# Altium schematic sheet NanoD1_Power.SchDoc
size 420 x 297 mm; ENG_APP_DATE: --/--/--; DSN_APP_DATE: --/--/--; CHK_APP_DATE: --/--/--; SheetNumber: 1; SheetTotal: 8
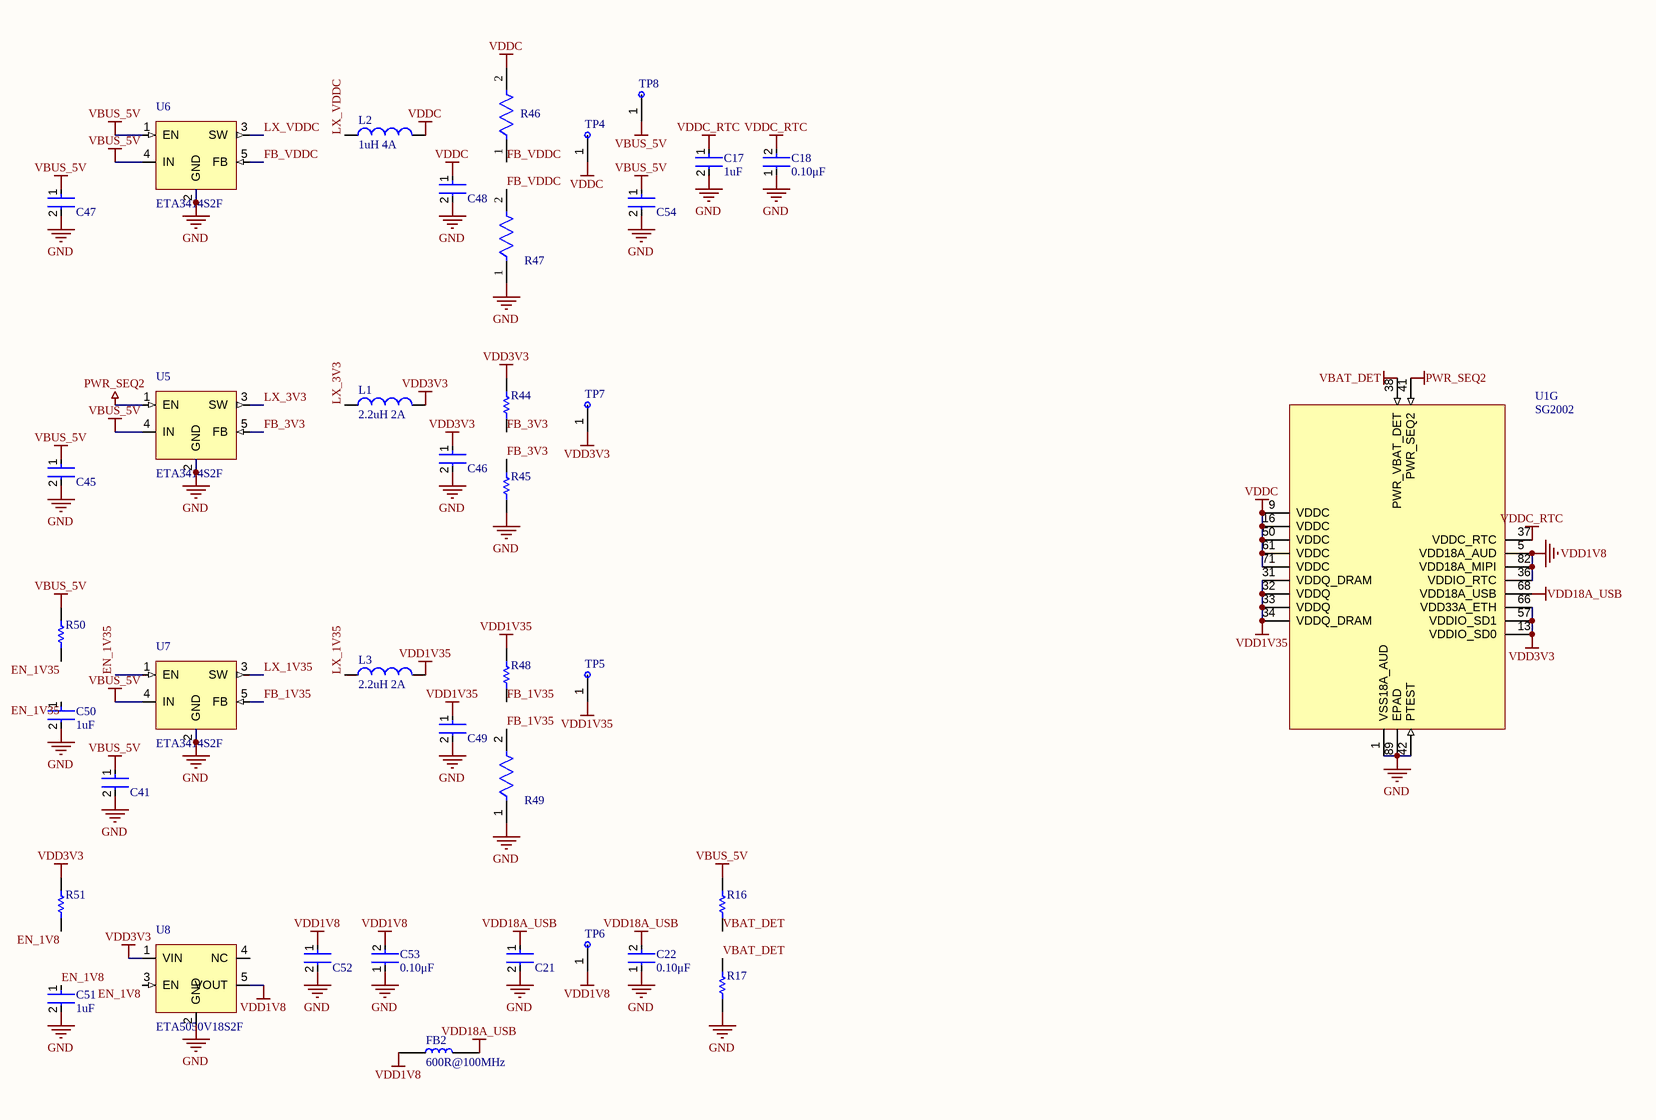
[diagram p0: NanoD1_Power.SchDoc]

## Parts
C17  1uF  [FP-GRM15-0_1-IPC_B]
C18  value 0.10μF  [FP-GRM15-MFG]  (hidden comment: 100nF)
C21  10uF  [FP-GRM188-0_15-IPC_B]  (value not drawn)
C22  value 0.10μF  [FP-GRM15-MFG]  (hidden comment: 100nF)
C41  22uF  [FP-GRM21B-0_15-MFG]  (value not drawn)
C45  22uF  [FP-GRM21B-0_15-MFG]  (value not drawn)
C46  22uF  [FP-GRM188-0_2-IPC_C]  (value not drawn)
C47  22uF  [FP-GRM21B-0_15-MFG]  (value not drawn)
C48  22uF  [FP-GRM188-0_2-IPC_C]  (value not drawn)
C49  22uF  [FP-GRM188-0_2-IPC_C]  (value not drawn)
C50  1uF  [FP-GRM15-0_1-IPC_B]
C51  1uF  [FP-GRM15-0_1-IPC_B]
C52  4.7uF  [FP-GRM155-0_15-MFG]  (value not drawn)
C53  value 0.10μF  [FP-GRM15-MFG]  (hidden comment: 100nF)
C54  22uF  [FP-GRM21B-0_15-MFG]  (value not drawn)
FB2  600R@100MHz  [INDC1608X95N]
L1  2.2uH 2A  [FP-DFE252010C-MFG]
L2  value 1uH 4A  [FP-DFE252010C-MFG]  (hidden comment: 1.0uH 4A)
L3  2.2uH 2A  [FP-DFE252010C-MFG]
R16  30K 1%  [RESC1005X40X25ML05T10]  (value not drawn)
R17  10K 1%  [RESC1005X40X25ML05T10]  (value not drawn)
R44  100K 1%  [RESC1005X40X25ML05T10]  (value not drawn)
R45  22K6 1%  [RESC1005X40X25ML05T10]  (value not drawn)
R46  11K8 1%  [FP-RC0402-0_4-MFG]  (value not drawn)
R47  20K 1%  [FP-RC0402-0_4-MFG]  (value not drawn)
R48  15K 1%  [RESC1005X40X25ML05T10]  (value not drawn)
R49  12K 1%  [FP-RC0402-0_4-MFG]  (value not drawn)
R50  33K  [RESC1005X40X25ML05T10]  (value not drawn)
R51  33K  [RESC1005X40X25ML05T10]  (value not drawn)
TP4  TP  [TP-1.5mm]  (value not drawn)
TP5  TP  [TP-1.5mm]  (value not drawn)
TP6  TP  [TP-1.5mm]  (value not drawn)
TP7  TP  [TP-1.5mm]  (value not drawn)
TP8  TP  [TP-1.5mm]  (value not drawn)
U1  SG2002  [QFN88-9x9-0.35]  (part G of 7)
U5  ETA3414S2F  [SOT23-5]
U6  ETA3414S2F  [SOT23-5]
U7  ETA3414S2F  [SOT23-5]
U8  ETA5050V18S2F  [SOT23-5]

## Nets
GND: C17.2 C18.1 C21.2 C22.1 C41.2 C45.2 C46.2 C47.2 C48.2 C49.2 C50.2 C51.2 C52.2 C53.1 C54.2 R17.1 R45.1 R47.1 R49.1 U1.1(VSS18A_AUD) U1.42(PTEST) U1.89(EPAD) U5.2(GND) U6.2(GND) U7.2(GND) U8.2(GND)
PWR_SEQ2: U1.41(PWR_SEQ2) U5.1(EN)
VBAT_DET: R16.1 R17.2 U1.38(PWR_VBAT_DET)
VBUS_5V: C41.1 C45.1 C47.1 C54.1 R16.2 R50.2 TP8.1(TP) U5.4(IN) U6.1(EN) U6.4(IN) U7.4(IN)
VDD1V8: C52.1 C53.2 FB2.1 TP6.1(TP) U1.5(VDD18A_AUD) U1.36(VDDIO_RTC) U1.82(VDD18A_MIPI) U8.5(VOUT)
VDD1V35: C49.1 L3.2 R48.2 TP5.1(TP) U1.31(VDDQ_DRAM) U1.32(VDDQ) U1.33(VDDQ) U1.34(VDDQ_DRAM)
VDD3V3: C46.1 L1.2 R44.2 R51.2 TP7.1(TP) U1.13(VDDIO_SD0) U1.57(VDDIO_SD1) U1.66(VDD33A_ETH) U8.1(VIN)
VDD18A_USB: C21.1 C22.2 FB2.2 U1.68(VDD18A_USB)
VDDC: C48.1 L2.2 R46.2 TP4.1(TP) U1.9(VDDC) U1.16(VDDC) U1.50(VDDC) U1.61(VDDC) U1.71(VDDC)
VDDC_RTC: C17.1 C18.2 U1.37(VDDC_RTC)
EN_1V8: C51.1 R51.1 U8.3(EN)
EN_1V35: C50.1 R50.1 U7.1(EN)
FB_1V35: R48.1 R49.2 U7.5(FB)
FB_3V3: R44.1 R45.2 U5.5(FB)
FB_VDDC: R46.1 R47.2 U6.5(FB)
LX_1V35: L3.1 U7.3(SW)
LX_3V3: L1.1 U5.3(SW)
LX_VDDC: L2.1 U6.3(SW)

Not connected (* = marked no-connect by the designer): U8 4(NC)

## Notes on the sheet
- THIS DOCUMENT AND THE DATA DISCLOSED HEREIN OR
- HEREWITH IS THE PROPERTY OF ALTIUM LIMITED AND MAY
- DWG NO:
- REVISION
- REV:
- DESCRIPTION
- DATE
- APPROVED
- BE FREELY DISTRIBUTED IN WHOLE. NO RIGHTS ARE
- RESERVED OR EXPRESS OR IMPLIED WARANTEE GIVEN.
- ENG:
- APPROVALS
- PROJECT
- DSN:
- CHK:
- REFERENCE DOCUMENTS
- PROJECT REVISION:
- TITLE
- DOCUMENT REVISION:
- DESIGN ITEM:
- BOM:
- FAB DWG:
- PCB DWG:
- ASSY DWG:
- SCALE:
- A3
- SIZE
- CAGE CODE
- FILE NAME
- DWG NO.
- SHEET
- OF
- REV

## Library data of the parts
C17 C50 C51 = CMP-2008-04556-2: CAP CER 1UF 10V X5R 0402; Manufacturer Part Number: GRM155R61A105KE15D; Manufacturer: Murata; Material: Ceramic; Tolerance: 10%; Temperature Coefficient: 15%; Value: 1uF; Octopart: https://octopart.com/grm155r61a105ke15d-murata-197442; Lead Free: Yes; ComponentLink2Description: Datasheet; Temperature: -55°C to +85°C; Temperature Range High: +85°C; Height: 0.55mm; Capacitance: 1uF; Ipc Land Pattern Name: CAPC10050X50; ComponentLink2URL: https://search.murata.co.jp/Ceramy/image/img/A01X/G101/ENG/GRM155R61A105KE15-01A.pdf; Temperature Range Low: -55°C; Device Class L2: Capacitors; Voltage Rating: 10V; RoHS: TRUE; Device Class L1: Passive Components; Device Class L3: Ceramic Capacitors; Temperature Characteristic: X5R; Mouser Description: 0402 1 uF 10 V ±10% Tolerance X5R Surface Mount Multilayer Ceramic Capacitor; Automotive: No; Package: GRM15-0.1; Digikey Description: CAP CER 1UF 10V X5R 0402; Category: Cap
C18 C22 C53 = CMP-2100-03641-2: CAP CER 0.1UF 16V X7R 0402; Manufacturer Part Number: GRM155R71C104KA88D; Manufacturer: Murata; Standoff Height: 0mm; Tolerance: 10%; Voltage Rating: 16Vdc; Material: Ceramic; RoHS: TRUE; Temperature Characteristic: X7R; Octopart: https://octopart.com/grm155r71c104ka88d-murata-196880; Digikey Description: CAP CER 0.1UF 16V X7R 0402; Device Class L3: Ceramic Capacitors; Height: 0.55mm; ComponentLink2Description: Datasheet; Temperature Range Low: -55°C; Ipc Land Pattern Name: CAPC10050X219; ComponentLink2URL: https://search.murata.co.jp/Ceramy/image/img/A01X/G101/ENG/GRM155R71H471KA01-01A.pdf; Device Class L1: Passive Components; Lead Free: yes; Category: Cap; Package: GRM15; Temperature: -55°C to +125°C; Device Class L2: Capacitors; Capacitance: 0.10μF; Temperature Range High: +125°C; Mouser Description: 0402 0.1 uF 16V ±10 % Tolerance X7R SMT Multilayer Ceramic Capacitor
C21 = CMP-06035-003612-1: Chip Multilayer Ceramic Capacitors for General Purpose, 0603, 10uF, X5R, 15%, 20%, 10V; Tolerance: 20%; Dielectric: X5R; Package Quantity: 4000; Width: 0.8mm; Case/Package: 0603; Thickness: 0.035inch; Capacitance: 10uF; Voltage Rating: 10V; Voltage Rating (DC): 10V; Termination: SMD/SMT; Length: 1.6mm; Lead Free: Lead Free; Mount: Surface Mount; Height: 0.8mm; Depth: 0.8mm; Packaging: Tape and Reel; Weight: 0.000222oz; Min Operating Temperature: -55°C; Case Code (Metric): 1608; Max Operating Temperature: 85°C; Case Code (Imperial): 0603; Material: Ceramic
C41 C45 C47 C54 = CMP-2000-06340-2: Chip Multilayer Ceramic Capacitors for General Purpose, 0805, 22uF, X5R, 15%, 20%, 10V; Thickness: 0.055inch; Length: 2mm; Tolerance: 20%; Max Operating Temperature: 85°C; REACH SVHC: No SVHC; Capacitance: 22uF; Voltage Rating: 10V; Weight: 0.000335oz; Case Code (Metric): 2012; Case Code (Imperial): 0805; Height: 1.25mm; Min Operating Temperature: -55°C; Voltage Rating (DC): 10V; Lead Free: Lead Free; Package Quantity: 3000; Case/Package: 0805; Dielectric: X5R; Mount: Surface Mount; Termination: SMD/SMT; Width: 0.049inch; Depth: 1.25mm; Packaging: Tape and Reel; Radiation Hardening: No
C46 C48 C49 = CMP-2000-06337-3: Chip Multilayer Ceramic Capacitors for General Purpose, 0603, 22uF, X5R, 15%, 20%, 10V; Thickness: 0.039inch; Length: 1.6mm; Tolerance: 20%; Max Operating Temperature: 85°C; REACH SVHC: No SVHC; Capacitance: 22uF; Voltage Rating: 10V; Weight: 0.000222oz; Case Code (Metric): 1608; Case Code (Imperial): 0603; Height: 0.8mm; Min Operating Temperature: -55°C; Voltage Rating (DC): 10V; Lead Free: Lead Free; Package Quantity: 4000; Case/Package: 0603; Dielectric: X5R; Mount: Surface Mount; Termination: SMD/SMT; Width: 0.8mm; Depth: 0.8mm; Packaging: Tape and Reel; Material: Ceramic
C52 = CMP-06035-003573-1: Chip Multilayer Ceramic Capacitors for General Purpose, 0402, 4.7uF, X5R, 15%, 20%, 10V; Case/Package: 0402; Voltage Rating: 10V; Min Operating Temperature: -55°C; Mount: Surface Mount; Packaging: Tape and Reel; Max Operating Temperature: 85°C; Capacitance: 4.7uF; Case Code (Metric): 1005; Case Code (Imperial): 0402; Tolerance: 20%
FB2 = MPZ1608S601ATA00: 600 Ohms @ 100 MHz 1 Power Line Ferrite Bead 0603 (1608 Metric) 1A 150mOhm; MF: TDK; SnapEDA_Link: https://www.snapeda.com/parts/MPZ1608S601ATA00/TDK/view-part/?ref=snap; Package: 0603 TDK; Value: 600R@100MHz; MP: MPZ1608S601ATA00; Check_prices: https://www.snapeda.com/parts/MPZ1608S601ATA00/TDK/view-part/?ref=eda
L1-L3 = Inductor: Code_IEC: 1005; Published: 8-Jun-2000; LatestRevisionDate: 29-May-2009; LatestRevisionNote: IPC-7351 Footprint Added.; PackageReference: 0402-A; Publisher: Altium Limited; PackageDescription: Chip Inductor; Code_JEITA: 0402
  L1 L3: Value: 2.2uH 2A
R16 = CMP-2002-07602-1: Manufacturer: Yageo / Phycomp; Part Number: RC0402FR-0730KL
R17 = CMP-2002-07353-1: Part Number: RC0402FR-0710KL; Manufacturer: Yageo / Phycomp
R44 = CMP-2002-07343-1: Part Number: RC0402FR-07100KL; Manufacturer: Yageo / Phycomp
R45 = CMP-2002-07516-1: Part Number: RC0402FR-0722K6L; Manufacturer: Yageo
R46 = CMP-2002-07909-2: NexarPartId: 9293467; Resistance: 11.8kΩ; Voltage Rating (DC): 50V; Temperature Coefficient: 100ppm/°C; Max Power Dissipation: 63mW; Depth: 500µm; Features: Moisture Resistant; Tolerance: 1%; Case Code (Metric): 1005; Number of Terminations: 2; Width: 508µm; Length: 1mm; Case Code (Imperial): 0402; Max Operating Temperature: 155°C; Composition: Thick Film; Case/Package: 0402; Contact Plating: Lead, Tin; Weight: 652.039032µg; Voltage Rating: 50V; Military Standard: Not; Radiation Hardening: No; Termination: SMD/SMT; RoHS: Compliant; Height: 400µm; Lead Free: Lead Free; Packaging: Tape & Reel; Min Operating Temperature: -55°C; Schedule B: 8533210045, 8533210045|8533210045, 8533210045|8533210045|8533210045, 8533210045|8533210045|8533210045|8533210045; Power Rating: 63mW
R47 = CMP-2002-07501-2: NexarPartId: 39794396; Resistance: 20kΩ; Max Power Dissipation: 63mW; Voltage Rating: 50V; Temperature Coefficient: 100ppm/°C; Power Rating: 62.5mW; Termination: SMD/SMT; Features: Moisture Resistant; Max Operating Temperature: 155°C; Number of Pins: 2; Length: 1mm; Min Operating Temperature: -55°C; RoHS: Compliant; Width: 500µm; Composition: Thick Film; Case/Package: 0402; Depth: 500µm; Lead Free: Lead Free; Height: 350µm; Packaging: Tape & Reel; Military Standard: Not; Tolerance: 1%; Case Code (Imperial): 0402; Case Code (Metric): 1005; Schedule B: 8533210045, 8533210045|8533210045|8533210045|8533210045|8533210045|8533210045|8533210045|8533210045|8533210045|8533210045|8533210045|8533210045|8533210045|8533210045|8533210045|8533210045|8533210045|8533210045|8533210045|8533210045|8533210045|8533210045|8533210045|85; Number of Terminations: 2; Voltage Rating (DC): 50V; REACH SVHC: No SVHC
R48 = CMP-2002-07410-1: Manufacturer: Yageo / Phycomp; Part Number: RC0402FR0715KL
R49 = CMP-2002-07378-2: RES SMD 12K OHM 1% 1/16W 0402; Power Rating: 62.5mW; Voltage Rating: 50V; Resistance: 12kR; Max Power Dissipation: 63mW; Temperature Coefficient: 100ppm/°C; Construction: Rectangular; Case Code (Metric): 1005; Package Quantity: 1; Weight: 2.3E-05oz; RoHS Compliant: Yes; Packaging: Tape and Reel; Case Code (Imperial): 0402; Military Standard: Not; Min Operating Temperature: -55°C; Depth: 0.5mm; Length: 1mm; Width: 0.02inch; Termination: SMD/SMT; Lead Free: Lead Free; Tolerance: 1%; REACH SVHC: No SVHC; Size Code: 0402; Resistance Tolerance: 1%; Series: RC; Max Operating Temperature: 155°C; Height: 0.016inch; Features: Moisture Resistant; Number of Terminations: 2; Case/Package: 0402; Resistor Type: Thick Film
R50 R51 = CMP-2002-07617-1: Part Number: RC0402FR-0733KL; Manufacturer: Yageo / Phycomp
TP4-TP8 = TestPoint: Test point, 1.5 mm exposed pad
U1 = SG2002: RISC-V C906 / Cortex-A53 SoC, 256MB DDR3 SiP, QFN88 9x9 0.35mm
U5-U7 = ETA3414: 1.5A 3MHz synchronous step-down converter, SOT23-5
U8 = ETA5050V18: 1.8V fixed LDO, SOT23-5